# Altium project 08_PCB_Project_08.PrjPcb
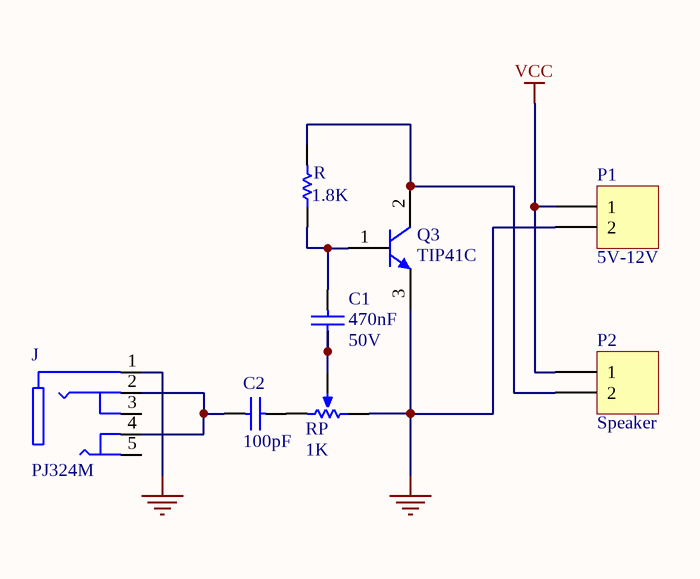
[diagram p0: Sheet1.SchDoc]
1 sheet, 8 parts. Net scope: global (net labels, ports and power ports of the same name join across sheets).
Board file: PCB1.pcbdoc

## Sheet Sheet1.SchDoc
size A; SheetNumber: 2; SheetTotal: 2

### Parts
C1  50V  value 470nF  [RAD-0.3]
C2  value 100pF  [RAD-0.3]  (hidden comment: Cap)
J  PJ324M  [WENZHOU_PJ324M]
P1  5V-12V  [HDR1X2]
P2  Speaker  [HDR1X2]
Q3  TIP41C  [ONSC-TO-220-3-221A-09]
R  value 1.8K  [AXIAL-0.3]  (hidden comment: Res1)
RP  value 1K  [VR5]  (hidden comment: RPot)

### Nets
GND: J.1(SLEEVE) P1.2 Q3.3(E) RP.1(TOP)
VCC: P1.1 P2.1
NetC1_1: C1.1 RP.3(TAP)
NetC1_2: C1.2 Q3.1(B) R.1
NetC2_1: C2.1 J.2(RING_1) J.4(TIP_1)
NetC2_2: C2.2 RP.2(BOT)
NetP2_2: P2.2 Q3.2(C) R.2

Not connected (* = marked no-connect by the designer): J 3(RING_2) 5(TIP_2)

### Library data of the parts
C1 C2 = Cap: Capacitor; Published: 8-Jun-2000; LatestRevisionDate: 17-Jul-2002; LatestRevisionNote: Re-released for DXP Platform.; PackageReference: RAD-0.3; Publisher: Altium Limited; PackageDescription: Radial Cap, Thru-Hole; 2 Leads; 0.3 in Pin Spacing
J = PJ324M: Headphone Stereo jack/Audio connector; MF: Wenzhou QingPu Electronics Co.Ltd; SnapEDA_Link: https://www.snapeda.com/parts/PJ324M/Wenzhou+QingPu+Electronics+Co.Ltd/view-part/?ref=snap; Package: Package; Value: *; MP: PJ324M; Check_prices: https://www.snapeda.com/parts/PJ324M/Wenzhou+QingPu+Electronics+Co.Ltd/view-part/?ref=eda
P1 P2 = Header 2: Header, 2-Pin; LatestRevisionDate: 17-Jul-2002; LatestRevisionNote: Re-released for DXP Platform.; Publisher: Altium Limited
Q3 = CMP-1048-01171-1: Complementary Silicon Plastic Power Transistor, 3-Pin TO-220, Tube; Manufacturer: On Semiconductor; Polarity: NPN; IC Continuous (A): 6; fT Min (MHz): 3; Packing: Tube; PackageVersion: Rev. AG, 09/2011; ComponentLink2URL: http://www.onsemi.com/pub_link/Collateral/TIP41A-D.PDF; ComponentLink1Description: Manufacturer URL; PackageDescription: 3-Pin Flange Mount, Vertical Straight Lead, Body 9.97 x 4.445 mm, Pitch 2.54 mm; ComponentLink3Description: Package Specification; ComponentLink3URL: http://www.onsemi.com/pub_link/Collateral/221A-09.PDF; RoHS: FALSE; PartNumber: TIP41C; DatasheetVersion: Rev. 10; ComponentLink2Description: Datasheet; ComponentLink1URL: http://www.onsemi.com/; Mounting Technology: Through Hole; PackageReference: TO-220-3-221A-09
R = Res1: Resistor; Published: 8-Jun-2000; LatestRevisionDate: 17-Jul-2002; LatestRevisionNote: Re-released for DXP Platform.; PackageReference: AXIAL-0.3; Publisher: Altium Limited; PackageDescription: Axial Device, Thru-Hole; 2 Leads; 0.3 in Pin Spacing
RP = RPot: Potentiometer; Sim Note: Enter the Resistance value and the set point into parameter fields.; Set Position: 0.5; Published: 8-Jun-2000; LatestRevisionDate: 17-Jul-2002; LatestRevisionNote: Re-released for DXP Platform.; PackageReference: VR5; Publisher: Altium Limited; PackageDescription: Variable Resistor, Thru-Hole; 3 Leads